# EAGLE design source_eagle (EAGLE 9.6.2)
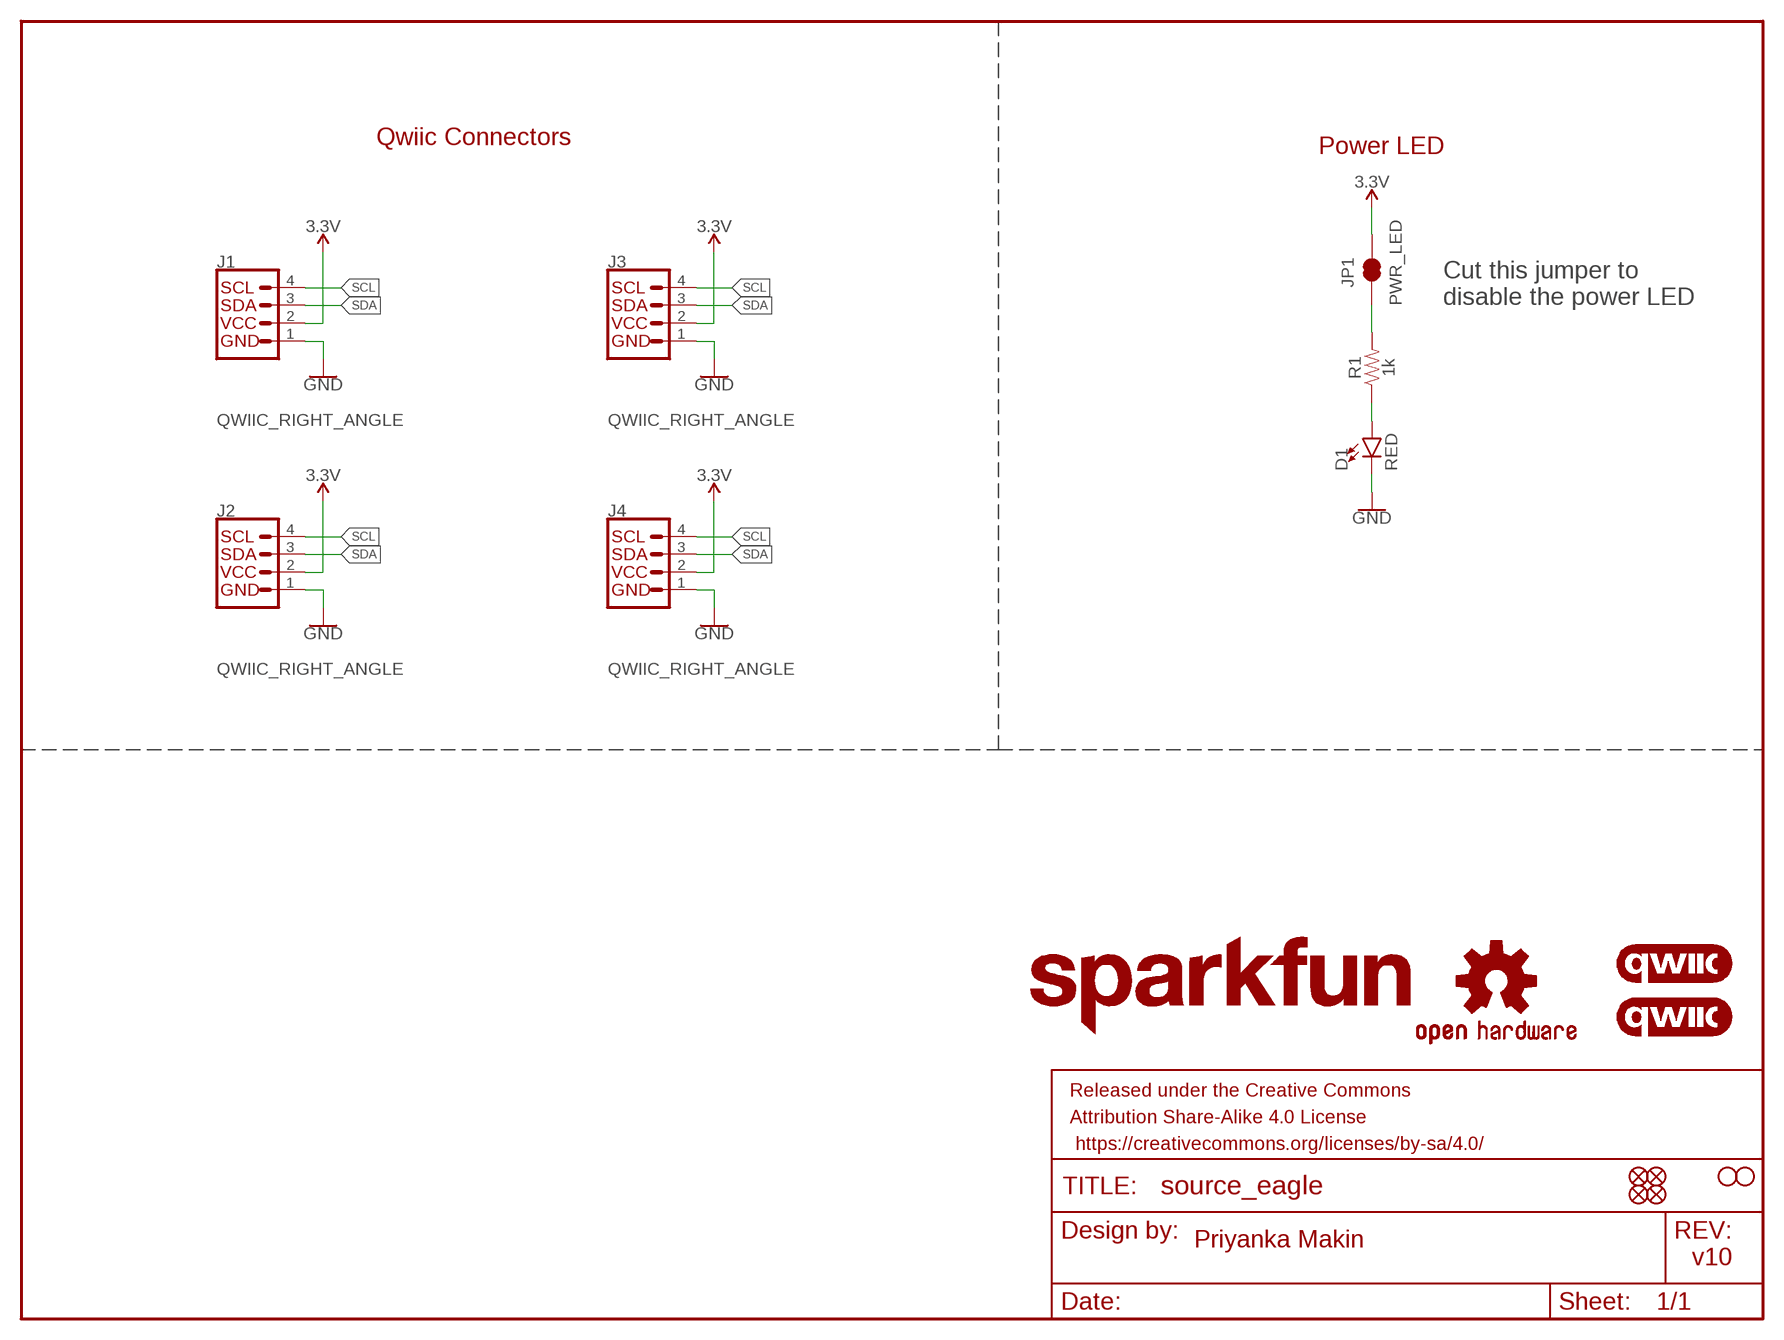
[diagram p0: schematic, sheet 1]

## Parts
D1  RED  LED-RED0603  [LED-0603]
FD1  FIDUCIALUFIDUCIAL  [FIDUCIAL-MICRO]
FD2  FIDUCIALUFIDUCIAL  [FIDUCIAL-MICRO]
FD3  FIDUCIALUFIDUCIAL  [FIDUCIAL-MICRO]
FD4  FIDUCIALUFIDUCIAL  [FIDUCIAL-MICRO]
FRAME1  FRAME-LETTER  [CREATIVE_COMMONS]
H1  STAND-OFFTIGHT  [STAND-OFF-TIGHT]
H2  STAND-OFFTIGHT  [STAND-OFF-TIGHT]
J1  QWIIC_RIGHT_ANGLE  QWIIC_CONNECTORJS-1MM  [JST04_1MM_RA]
J2  QWIIC_RIGHT_ANGLE  QWIIC_CONNECTORJS-1MM  [JST04_1MM_RA]
J3  QWIIC_RIGHT_ANGLE  QWIIC_CONNECTORJS-1MM  [JST04_1MM_RA]
J4  QWIIC_RIGHT_ANGLE  QWIIC_CONNECTORJS-1MM  [JST04_1MM_RA]
JP1  PWR_LED  JUMPER-SMT_2_NC_TRACE_SILK  [SMT-JUMPER_2_NC_TRACE_SILK]
LOGO1  QWIIC_LOGO_5MM  [QWIIC_5MM]
LOGO2  QWIIC_LOGO_5MM  [QWIIC_5MM]
LOGO3  OSHW-LOGOS  [OSHW-LOGO-S]
LOGO4  SFE_LOGO_NAME.2_INCH  [SFE_LOGO_NAME_.2]
R1  1k  1KOHM-0603-1/10W-1%  [0603]

## Nets
3.3V: J1.2 J2.2 J3.2 J4.2 JP1.2
GND: D1.C J1.1 J2.1 J3.1 J4.1
N$1: D1.A R1.1
N$2: JP1.1 R1.2
SCL: J1.4 J2.4 J3.4 J4.4
SDA: J1.3 J2.3 J3.3 J4.3

## Notes on the sheet
- Qwiic Connectors
- Power LED
- Cut this jumper to 
  disable the power LED
- Priyanka Makin
- v10

## Library data of the parts
D1 = SparkFun-LED:LED-RED: Red SMD LED Used in manufacturing of most products at SparkFun Packages: 0603 - SMD 0603 package [Product Link] <http://docs.avagotech.com/docs/AV02-0551EN> 0603 SMART - SMD 0603 SMART package ( more efficient and expensive)[Product Link] <http://www.osram-os.com/Graphics/XPic2/00077099_0.pdf> 1206 - SMD1206 package [Product Link] <https://www.sparkfun.com/datasheets/DevTools/LilyPad/Q150OVS4.pdff> SparkFun Products: Pro Mini 328 -5V <https://www.sparkfun.com/products/821> RedBoard <https://www.sparkfun.com/products/12757> IOIO-OTG <https://www.sparkfun.com/products/13613>; PROD_ID: DIO-00819
FD1-FD4 = SparkFun-Aesthetics:FIDUCIAL: Fiducial Alignment Points Point-of-reference for pick-and-place machines and other optical instruments.
FRAME1 = SparkFun-Aesthetics:FRAME-LETTER: Schematic Frame - Letter Standard 8.5x11 US Letter frame
H1 H2 = SparkFun-Hardware:STAND-OFF: Stand Off Drill holes for mechanically mounting via screws, standoffs, etc. Note: Use the keepout ring to avoid running the screw head into surrounding components. Variant Overviews STAND-OFF - Mechanical footprint for a #4 phillips button head screw. STAND-OFF-TIGHT - Mechanical footprint for a #4 phillips button head screw, Example SparkFun Products Screw - Phillips Head (1/4", 4-40, 10 pack) (PRT-10453) Screw - Phillips Head (1/2", 4-40, 10 pack) (PRT-10452) Screw - Phillips Head (3/4", 4-40, 10 pack) (PRT-10451) Screw - Phillips Head (1", 4-40, 10 pack) (PRT-10450)
J1-J4 = SparkFun-Connectors:QWIIC_CONNECTOR: SparkFun I2C Standard Qwiic Connector An SMD 1mm pitch JST connector makes it easy and quick (get it? Qwiic?) to connect I2C devices to each other. The Qwiic system <http://www.sparkfun.com/qwiic> enables fast and solderless connection between popular platforms and various sensors and actuators. We carry 200mm <https://www.sparkfun.com/products/14204>, 100mm <https://www.sparkfun.com/products/14205>, 50mm <https://www.sparkfun.com/products/14206>, and breadboard friendly <https://www.sparkfun.com/products/14207> Qwiic cables. We also offer 10 pcs strips <https://www.sparkfun.com/products/14323> the SMD connectors.; PROD_ID: CONN-13694
JP1 = SparkFun-Jumpers:JUMPER-SMT_2_NC_TRACE: Normally closed trace jumper This jumper has a trace between two pads so it's normally closed (NC). Use a razor knife to open the connection. For best results follow the IPC guidelines for cutting traces: Cutout at least 0.063 mm (0.005 in). Remove all loose material to clean up the cut area. Seal the cut with an approved epoxy. Reapply solder to reclose the connection.
LOGO1 LOGO2 = SparkFun-Aesthetics:QWIIC_LOGO: Qwiic Logos for placement on schematic and PCB. The 5.5mm silk logo is best for placing next to Qwiic connector.
LOGO3 = SparkFun-Aesthetics:OSHW-LOGO: Open-Source Hardware (OSHW) Logo This logo indicates the piece of hardware it is found on incorporates a OSHW license and/or adheres to the definition of open source hardware found here: http://freedomdefined.org/OSHW
LOGO4 = SparkFun-Aesthetics:SFE_LOGO_NAME: SparkFun Font Logo This is the SparkFun name logo. The logo on the schematic will always be the same size; the package variant is the height of the flame part of the logo (or the height the flame would be, if it were drawn). Default layer for the logo on the board is tSilk.
R1 = SparkFun-Resistors:1KOHM: 1kΩ resistor A resistor is a passive two-terminal electrical component that implements electrical resistance as a circuit element. Resistors act to reduce current flow, and, at the same time, act to lower voltage levels within circuits. - Wikipedia; PROD_ID: RES-07856

## Board
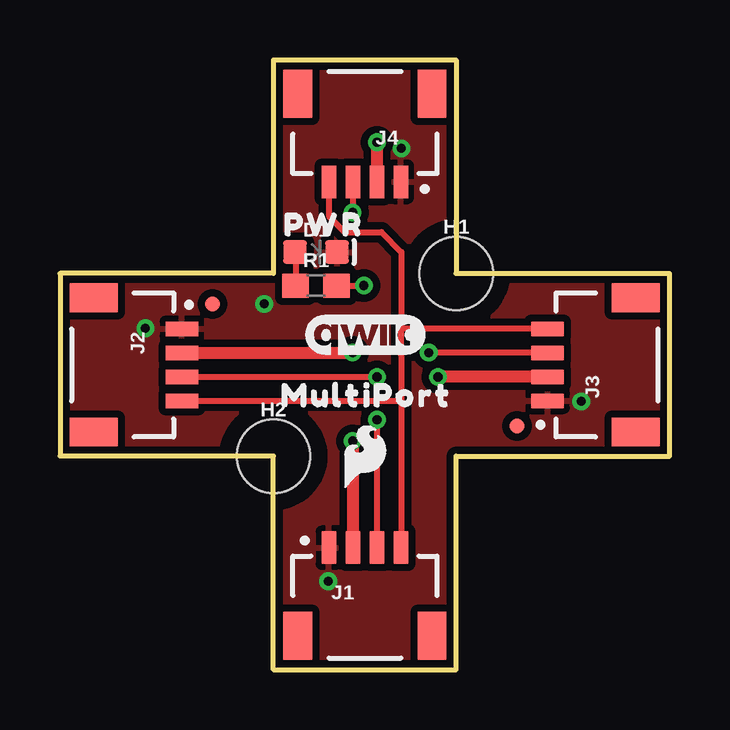
[diagram p1: board, top side]
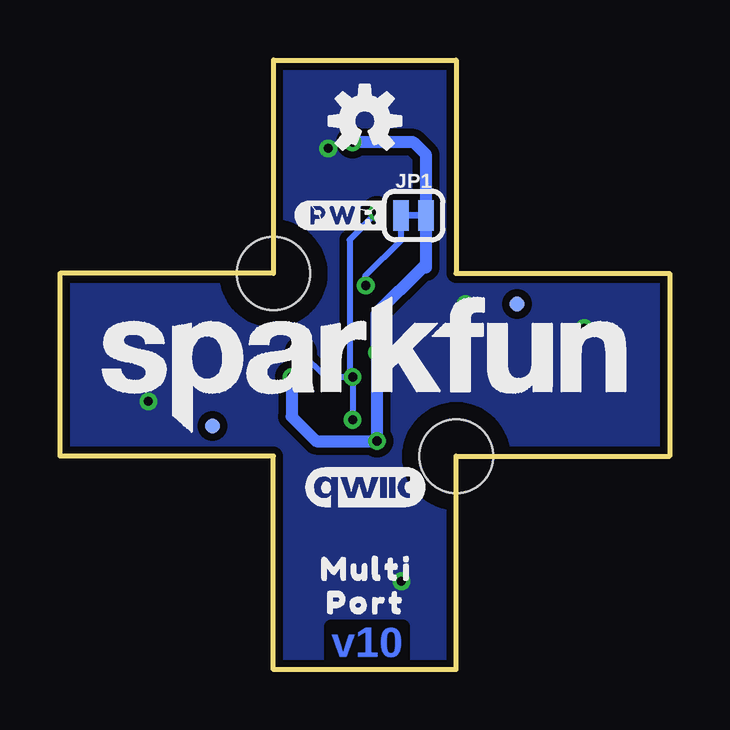
[diagram p2: board, bottom side, seen from below]

Size 25.4 x 25.4 mm. Coordinates in mm from the lower left corner, seen from the top.
Outline: 8.89,0 16.51,0 16.51,8.89 25.4,8.89 25.4,16.51 16.51,16.51 16.51,25.4 8.89,25.4 8.89,16.51 0,16.51 0,8.89 8.89,8.89 8.89,0
Copper layers (1*16): Top 0.035mm / dielectric 1.5mm / Bottom 0.035mm
Design rules "SparkFun-2-Layer-General-JLCPCB": minimum track width 7mil, minimum drill 0.3mm, track to track 7mil, track to pad 7mil, pad to pad 7mil, via to via 7mil, smd to smd 7mil, copper to edge 7mil, drill to drill 7mil, minimum pad ring 7mil, minimum via ring 7mil, stop-mask expansion 3mil, vias tented up to drill 25mil, thermal gap 10mil

### Footprints (pad centres in the part's own frame; a part is rotated, then mirrored left to right if it is on the bottom)
LED-0603 = smd 1 x 1: A -0.877,0; C 0.877,0
FIDUCIAL-MICRO = smd 0.635 x 0.635: 1 0,0
STAND-OFF-TIGHT = hole 3.048: 0,0
JST04_1MM_RA = smd 0.6 x 1.35: 1 -1.5,0; 2 -0.5,0; 3 0.5,0; 4 1.5,0 | smd 1.2 x 2: NC1 2.8,-3.675; NC2 -2.8,-3.675
SMT-JUMPER_2_NC_TRACE_SILK = smd 0.66 x 1.27: 1 -0.521,0; 2 0.521,0
0603 = smd 1.1 x 1: 1 -0.85,0; 2 0.85,0

### Placement (x,y rotation side)
D1  10.67,17.4 0 top
FD1  6.35,15.24 0 bottom
FD2  6.35,15.24 0 top
FD3  19.05,10.16 0 top
FD4  19.05,10.16 0 bottom
FRAME1  not placed on the board
H1  16.51,16.51 0 top
H2  8.89,8.89 0 top
J1  12.7,5.08 0 top
J2  5.08,12.7 270 top
J3  20.32,12.7 90 top
J4  12.7,20.32 180 top
JP1  10.67,18.92 0 bottom
LOGO1  12.7,13.97 0 top
LOGO2  12.7,7.62 0 bottom
LOGO3  12.7,22.86 0 bottom
LOGO4  12.7,12.7 0 bottom
R1  10.67,16 0 top
U$1  [PWR0]  8.64,18.54 0 top
U$2  [SFE_LOGO_FLAME_.1]  12.7,8.89 0 top
U$4  [MULTIPORT0]  8.51,11.43 0 top
U$5  [#PWR#0]  15.62,18.92 0 bottom
U$9  [PWR0]  8.64,18.54 0 top
U$11  [MULTI0]  15.24,4.19 0 bottom
U$13  [PORT0]  14.99,2.79 0 bottom

### Tracks (layer width: path | path; a pad name or v marks a point on that pad's centre or on a via)
3.3V  (via drill 0.38)
  Top 0.508: J2.2 v12.18,13.2 v12.19,13.21 | v12.19,9.53 J1.2 | v13.21,21.97 J4.2 | J3.2 v15.76,12.2 v15.75,12.19
  Bottom 0.508: v13.21,21.97 10.67,21.97 10.15,21.45 JP1.2 10.16,16.76 10.29,16.76 12.19,14.86 v12.19,13.21 v12.19,9.53 14.73,9.53 15.75,10.54 v15.75,12.19
GND  (via drill 0.38)
  other vias: 11.18,3.68 3.56,14.22 14.22,21.72 21.72,11.18 8.51,15.24
  pour Top (isolate 0.305): 0,16.51 0,8.89 8.89,8.89 8.89,0 16.51,0 16.51,8.89 25.4,8.89 25.4,16.51 16.51,16.51 16.51,25.4 8.89,25.4 8.89,16.51
  pour Bottom (isolate 0.305): 0,16.51 0,8.89 8.89,8.89 8.89,0 16.51,0 16.51,8.89 25.4,8.89 25.4,16.51 16.51,16.51 16.51,25.4 8.89,25.4 8.89,16.51
N$1
  Top 0.254: D1.A 9.82,17.37 R1.1
N$2  (via drill 0.38)
  Top 0.254: R1.2 v12.66,16
  Bottom 0.254: v12.66,16 12.7,16.04 12.7,16.38 11.19,17.89 JP1.1
SCL
  Top 0.254: J2.4 14.2,11.2 14.22,11.18 | 14.22,11.18 14.22,5.1 J1.4 | J3.4 14.22,14.2 | 14.22,11.18 14.22,12.7 14.22,13.08 14.22,14.2 | J4.4 11.2,18.9 11.87,18.22 13.4,18.22 14.22,17.4 14.22,14.2
SDA  (via drill 0.38)
  Top 0.254: J1.3 v13.21,10.41 | J2.3 v13.2,12.2 v13.21,12.19 | J3.3 v15.38,13.2 v15.37,13.21 | J4.3 v12.2,19.06 v12.19,19.05
  Bottom 0.254: v13.21,12.19 v13.21,10.41 | v15.37,13.21 14.35,12.19 v13.21,12.19 | v12.19,19.05 13.34,17.91 13.34,12.32 v13.21,12.19

### Text on the board
Bottom: v10
Measures: in | in
tDocu: Priyanka Makin